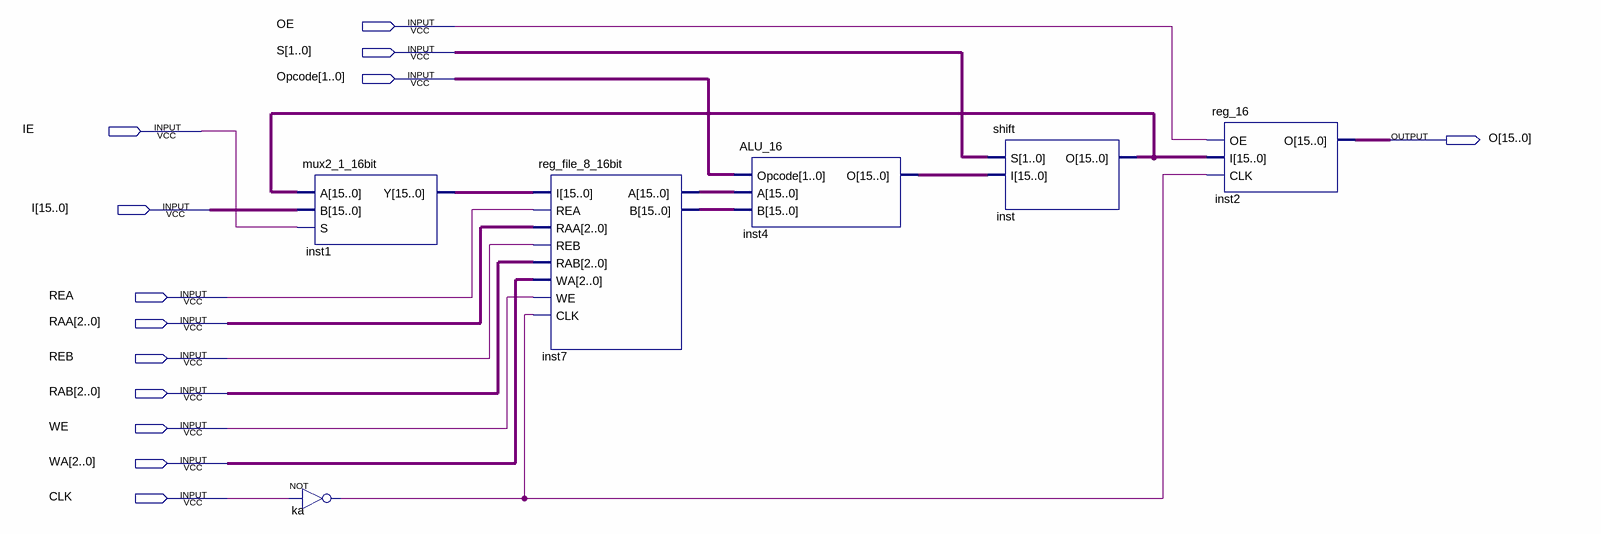
[diagram p0: schematic sheet]
// Quartus schematic datapath.bdf as structural Verilog: 6 symbols, 13 pins
module datapath (
  input  OE,
  input  [1:0] S,
  input  [1:0] Opcode,
  input  IE,
  input  [15:0] I,
  input  REA,
  input  [2:0] RAA,
  input  REB,
  input  [2:0] RAB,
  input  WE,
  input  [2:0] WA,
  input  CLK,
  output [15:0] O
);

  wire ka_out;
  wire [15:0] inst1_y, inst4_o, inst7_a, inst7_b, inst_o;

  mux2_1_16bit inst1 (.A(inst_o), .B(I), .S(IE), .Y(inst1_y));
  not ka (ka_out, CLK);
  reg_file_8_16bit inst7 (
    .I(inst1_y), .REA(REA), .RAA(RAA), .REB(REB), .RAB(RAB), .WA(WA), .WE(WE), .CLK(ka_out), .A(inst7_a),
    .B(inst7_b));
  ALU_16 inst4 (.Opcode(Opcode), .A(inst7_a), .B(inst7_b), .O(inst4_o));
  shift inst (.S(S), .I(inst4_o), .O(inst_o));
  reg_16 inst2 (.OE(OE), .I(inst_o), .CLK(ka_out), .O(O));
endmodule
